# Altium schematic sheet CAN2_SPI_CAN_CONTROLLER.SchDoc
size A4; SheetNumber: 3; SheetTotal: 20; ENG_APP_DATE: --/--/--; DSN_APP_DATE: --/--/--; CHK_APP_DATE: --/--/--
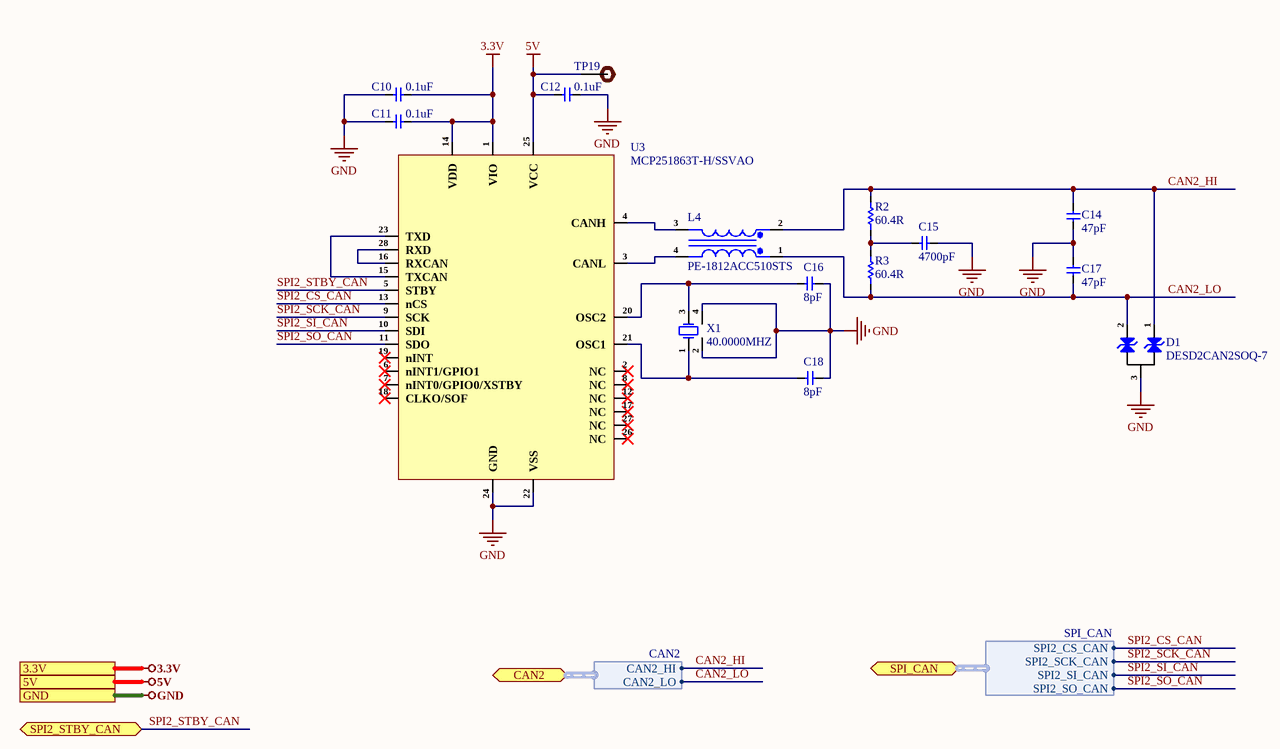
[diagram p0: CAN2_SPI_CAN_CONTROLLER.SchDoc]

## Parts
C10  0.1uF  [Cap-0402]
C11  0.1uF  [Cap-0402]
C12  0.1uF  [Cap-0402]
C14  47pF  [Cap-0805]
C15  4700pF  [Cap-1206]
C16  8pF  [CAP-0201]
C17  47pF  [Cap-0805]
C18  8pF  [CAP-0201]
D1  DESD2CAN2SOQ-7  [SOT-23]
L4  PE-1812ACC510STS  [PE-1812ACC510STS]
R2  60.4R  [Res-0603]
R3  60.4R  [Res-0603]
TP19  DNP  [Test-point]  (value not drawn)
U3  MCP251863T-H/SSVAO  [SSOP-28-208mil]
X1  40.0000MHZ  [NX2016SA-40M-STD-CZS-3]

## Ports
3.3V (see Top_Sheet[1A], 03-CAN2_SPI_CAN_CONTROLLER[1D], APALIS_POWER_SUPPLY[1D], DC_DC_CONVERTER[1D], GPIO_NC_INTERFACE[4B], I2C_INTERFACE[1B], LTE_MODULE[1D], Reset_and_SDIO[1D]), 5V (see Top_Sheet[1A], 03-CAN2_SPI_CAN_CONTROLLER[1D], DC_DC_CONVERTER[1D]), CAN2 (bidir, harness CAN2, see Top_Sheet[1B], CONNECTORS[3C]), GND (see Top_Sheet[1A], 03-CAN2_SPI_CAN_CONTROLLER[1D], APALIS_POWER_SUPPLY[1D], CODEC_INTERFACE[1D], CONNECTORS[1D], DC_DC_CONVERTER[1D], DIGITAL_I-O_O-P[1D], ETHERNET_INTERFACE[1D], FUTURE_USE_CONNECTOR[1D], GPIO_NC_INTERFACE[4B], HDMI_INTERFACE[1D], I2C_INTERFACE[1B], INPUT_SUPPLY_PROTECTION[1D], LTE_MODULE[1D], MECHANICAL_FOR_PCB[1D], MICRO_SD_CARD_INTERFACE[1D], Reset_and_SDIO[1D], UART_INTERFACE[1D], USB3.0_INTERFACE[1D]), SPI2_STBY_CAN (bidir, see Top_Sheet[1A], GPIO_NC_INTERFACE[4A]), SPI_CAN (bidir, harness SPI_CAN, see Top_Sheet[1B], FUTURE_USE_CONNECTOR[3D])

## Harnesses
SPI_CAN: SPI2_CS_CAN, SPI2_SCK_CAN, SPI2_SI_CAN, SPI2_SO_CAN
CAN2: CAN2_HI, CAN2_LO

## Nets
3.3V: C10.1 C11.1 U3.1(VIO) U3.14(VDD) ; port 3.3V
5V: C12.2 TP19.1 U3.25(VCC) ; port 5V
GND: C10.2 C11.2 C12.1 C14.1 C15.2 C16.2 C17.2 C18.1 D1.3 U3.22(VSS) U3.24(GND) X1.2(GND) X1.4(GND) ; port GND
CAN2_HI: C14.2 D1.1 L4.2 R2.2 ; port CAN2.CAN2_HI
CAN2_LO: C17.1 D1.2 L4.1 R3.1 ; port CAN2.CAN2_LO
SPI2_CS_CAN: U3.13(nCS) ; port SPI_CAN.SPI2_CS_CAN
SPI2_SCK_CAN: U3.9(SCK) ; port SPI_CAN.SPI2_SCK_CAN
SPI2_SI_CAN: U3.10(SDI) ; port SPI_CAN.SPI2_SI_CAN
SPI2_SO_CAN: U3.11(SDO) ; port SPI_CAN.SPI2_SO_CAN
SPI2_STBY_CAN: U3.5(STBY) ; port SPI2_STBY_CAN
NetC15_1: C15.1 R2.1 R3.2
NetC16_1: C16.1 U3.20(OSC2) X1.3(Out/In)
NetC18_2: C18.2 U3.21(OSC1) X1.1(In/Out)
NetL4_3: L4.3 U3.4(CANH)
NetL4_4: L4.4 U3.3(CANL)
NetU3_15: U3.15(TXCAN) U3.23(TXD)
NetU3_16: U3.16(RXCAN) U3.28(RXD)

Not connected (* = marked no-connect by the designer): U3 2(NC)* 6(nINT1/GPIO1)* 7(nINT0/GPIO0/XSTBY)* 8(NC)* 12(NC)* 17(NC)* 18(CLKO/SOF)* 19(nINT)* 26(NC)* 27(NC)*

## Library data of the parts
C10-C12 = C0402C104K4REC7867: Cap Cer 0402 0.1UF 16V X7R 10%; Manufacturer: KEMET; Item Type: Capacitor; Supplier: Digi-Key; Supplier Part Number: 399-C0402C104K4REC7867CT-ND; Manufacturer Part Number: C0402C104K4REC7867; RoHS: No; Category: Ceramic Capacitors; Stock: 10918; Pricing: 1=0.1, 10=0.072, 50=0.0408, 100=0.0338, 500=0.02372, 1000=0.01963, 2500=0.01827, 5000=0.01672 (USD)
C14 C17 = C0805C470K5RACAUTO: Cap Cer 47PF 50V X7R 0805; Manufacturer: KEMET; Supplier: Mouser; Supplier Part Number: 80-C0805C470K5RAUTO; Manufacturer Part Number: C0805C470K5RACAUTO; RoHS: Yes; Category: Ceramic Capacitors; Stock: 12731; Pricing: 1=0.23, 10=0.094, 50=0.094, 100=0.055, 1000=0.048, 10000=0.037 (USD); ComponentLink1URL: https://datasheet.octopart.com/C0805C470K5RACAUTO-KEMET-datasheet-158277466.pdf?src-supplier=Element14; ComponentLink1Description: https://datasheet.octopart.com/C0805C470K5RACAUTO-KEMET-datasheet-158277466.pdf?src-supplier=Element14
C15 = C1206C472K5RACAUTO: CAP CER 4700PF 50V X7R 1206; Manufacturer: KEMET; Supplier: Mouser; Supplier Part Number: 80-C1206C472K5RAUTO; Manufacturer Part Number: C1206C472K5RACAUTO; RoHS: Yes; Category: Ceramic Capacitors; Stock: 3869; Pricing: 1=0.18, 10=0.075, 50=0.075, 100=0.044, 1000=0.036, 10000=0.028 (USD); ComponentLink1URL: https://datasheet.ciiva.com/6259/datasheetpn-c1206c472k5racauto-6259849.pdf?src-supplier=Digi-Key; ComponentLink1Description: https://datasheet.ciiva.com/6259/datasheetpn-c1206c472k5racauto-6259849.pdf?src-supplier=Digi-Key
C16 C18 = CGA1A2C0G1H080D030BA: CAP CER 8PF 50V C0G 0201; Manufacturer: TDK; Material: 4241ConductorMaterial; Temperature Coefficient: 30ppm/°C; Supplier: Digi-Key; Supplier Part Number: 445-12057-1-ND; Manufacturer Part Number: CGA1A2C0G1H080D030BA; RoHS: Yes; Category: Ceramic Capacitors; Stock: 40913; Pricing: 1=0.11, 10=0.078, 50=0.0424, 100=0.0346, 500=0.02474, 1000=0.01944, 2500=0.01768, 5000=0.01626 (USD); Mounting Technology: Surface Mount; Case/Package: 0201; Case Code (Metric): 0603; Case Code (Imperial): 0201; Weight: 6E-06oz; Min Operating Temperature: -55°C; Max Operating Temperature: 125°C; Package Quantity: 15000; Packaging: Tape and Reel; Value: 8pF; Voltage Rating: 50V; Voltage Rating (DC): 50V; Dielectric: C0G; Termination: SMD/SMT; Series: CGA; Length: 0.6mm; Width: 0.3mm; Height: 0.3mm; Ratings: AEC-Q200; RoHS Compliant: Yes; ComponentLink1URL: https://datasheet.ciiva.com/24221/mlcc-automotive-general-en-24221484.pdf?src-supplier=Mouser; ComponentLink1Description: https://datasheet.ciiva.com/24221/mlcc-automotive-general-en-24221484.pdf?src-supplier=Mouser
D1 = DESD2CAN2SOQ-7: TVS DIODE 24VWM 41VC SOT23; Manufacturer: Diodes; Number of Bidirectional Channels: 2; Reverse Standoff Voltage: 24V; Min Breakdown Voltage: 25.4V; Peak Pulse Power: 230W; Power Line Protection: No; Peak Pulse Current: 5A; Diode Type: ZENER; Supplier: Future Electronics; Supplier Part Number: 5053887; Manufacturer Part Number: DESD2CAN2SOQ-7; RoHS: Yes; Category: TVS Diodes; Stock: 18000; Pricing: 3000=0.109, 6000=0.107, 12000=0.105, 15000=0.104, 45000=0.101 (USD); Mounting Technology: Surface Mount; Case/Package: TO-236-3; Min Operating Temperature: -65°C; Max Operating Temperature: 150°C; Packaging: Cut Tape; Series: Automotive, AEC-Q101; RoHS Compliant: Yes; ComponentLink1URL: http://www.farnell.com/datasheets/2814365.pdf?src-supplier=Farnell; ComponentLink1Description: http://www.farnell.com/datasheets/2814365.pdf?src-supplier=Farnell; ComponentLink2URL: http://www.mouser.com/ds/2/115/DESD2CAN2SOQ-520157.pdf?src-supplier=Mouser; ComponentLink2Description: http://www.mouser.com/ds/2/115/DESD2CAN2SOQ-520157.pdf?src-supplier=Mouser; ComponentLink3URL: http://www.farnell.com/datasheets/2814365.pdf?src-supplier=Newark; ComponentLink3Description: http://www.farnell.com/datasheets/2814365.pdf?src-supplier=Newark; ComponentLink4URL: http://www.farnell.com/datasheets/2814365.pdf?src-supplier=Element14; ComponentLink4Description: http://www.farnell.com/datasheets/2814365.pdf?src-supplier=Element14; ComponentLink5URL: https://www.diodes.com/assets/Datasheets/DESD2CAN2SOQ.pdf?src-supplier=Digi-Key; ComponentLink5Description: https://www.diodes.com/assets/Datasheets/DESD2CAN2SOQ.pdf?src-supplier=Digi-Key
L4 = PE-1812ACC510STS: CMC 230MA 2LN 3.5KOHM SMD; Manufacturer: Pulse Electronics Network; Supplier: Future Electronics; Supplier Part Number: 5113590; Manufacturer Part Number: PE-1812ACC510STS; RoHS: No
R2 R3 = RC0603FR-0760R4L: RES 60.4 OHM 1% 1/10W 0603; Manufacturer: Yageo; Supplier: Rs; Supplier Part Number: 2424164; Manufacturer Part Number: RC0603FR-0760R4L; RoHS: Yes; Category: Chip SMD Resistors; Stock: 8600; Pricing: 100=0.008, 1000=0.007, 2000=0.006 (GBP); ComponentLink1URL: https://datasheet.ciiva.com/12558/rc0603-272842-12558933.pdf?src-supplier=Mouser; ComponentLink1Description: https://datasheet.ciiva.com/12558/rc0603-272842-12558933.pdf?src-supplier=Mouser
TP19 = TEST POINT: Test Point ON; Item Type: TEST POINT
U3 = MCP251863T-H/SSVAO: STAND-ALONE LOW POWER CAN FD CON; Manufacturer: Microchip; Item Type: IC; Supplier: Digi-Key; Supplier Part Number: 150-MCP251863T-H/SSVAOTR-ND; Manufacturer Part Number: MCP251863T-H/SSVAO; RoHS: No; Category: Uncategorized
X1 = NX2016SA-40M-STD-CZS-3: Crystal 40.0000MHZ 8PF SMD; Manufacturer: NDK; Frequency: 40MHz; Frequency Stability: 25ppm; Frequency Tolerance: 10ppm; ESR (Equivalent Series Resistance): 60R; Supplier: Rs; Supplier Part Number: 1847956; Manufacturer Part Number: NX2016SA-40M-STD-CZS-3; RoHS: Yes; Stock: 95; Pricing: 5=0.686 (GBP); Mounting Technology: Surface Mount; Case/Package: SMD/SMT; Min Operating Temperature: -40°C; Max Operating Temperature: 125°C; Packaging: Cut Tape; Load Capacitance: 8pF; Series: -; Ratings: AEC-Q200; RoHS Compliant: Yes; ComponentLink1URL: http://www.ndk.com/images/products/catalog/c_NX2016SA-2_e.pdf?src-supplier=Digi-Key; ComponentLink1Description: http://www.ndk.com/images/products/catalog/c_NX2016SA-2_e.pdf?src-supplier=Digi-Key